# Altium project KH-TYPE-C-16P.PrjPcb
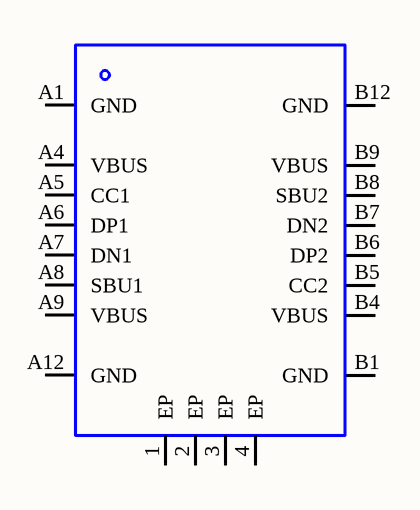
[diagram p0: KH-TYPE-C-16P.schdoc]
1 sheet, 1 parts. Net scope: global (net labels, ports and power ports of the same name join across sheets).

## Sheet KH-TYPE-C-16P.schdoc
size 127 x 101 mm

### Parts
USB?  kh-type-c-16p  [USB-C-SMD_KH-TYPE-C-16P]  (value not drawn)

### Nets

Not connected (* = marked no-connect by the designer): USB? 1(EP) 2(EP) 3(EP) 4(EP) A1(GND) A4(VBUS) A5(CC1) A6(DP1) A7(DN1) A8(SBU1) A9(VBUS) A12(GND) B1(GND) B4(VBUS) B5(CC2) B6(DP2) B7(DN2) B8(SBU2) B9(VBUS) B12(GND)

### Library data of the parts
USB? = kh-type-c-16p: 连接器类型:Type-C;协议标准:-;公母:母;安装方式:卧贴;触点数量:16P;端口数量:1;额定电流 - 电源:3A;工作温度:-40℃~+85℃;; Manufacturer: kinghelm(金航标); AddInBom: yes; ModelId: f2c381012fbf47e0b76dea5162270f01; ModelTransform: 351.9678,307.48,0,0,0,0,0,-45.276,-43.307; Connector Type: Type-C; Gender: 母; Number of Contacts: 16P; Number of Ports: 1; Current Rating-Power: 3A; Voltage Rating: 30V; Connect-Disconnect Life: 1万次; Symbol: KH-TYPE-C-16P; LCSC Part Name: Type-C 母 卧贴; SupplierPart: C709357; ManufacturerPart: KH-TYPE-C-16P; Supplier Footprint: SMD; JLCPCB Part Class: Extended Part; Datasheet: https://item.szlcsc.com/datasheet/KH-TYPE-C-16P/747093.html; Supplier: LCSC; ConvertToPcb: yes; FootprintName: USB-C-SMD_KH-TYPE-C-16P; ModelName: USB-C-SMD_KH-TYPE-C-16P; Protocol Standard: -; Mounting Type: 卧贴; Length: 7.81mm; Operating Temperature: -40℃~+85℃